# Altium schematic sheet signal-light-11.SchDoc
size A4; SheetNumber: 14; SheetTotal: 21
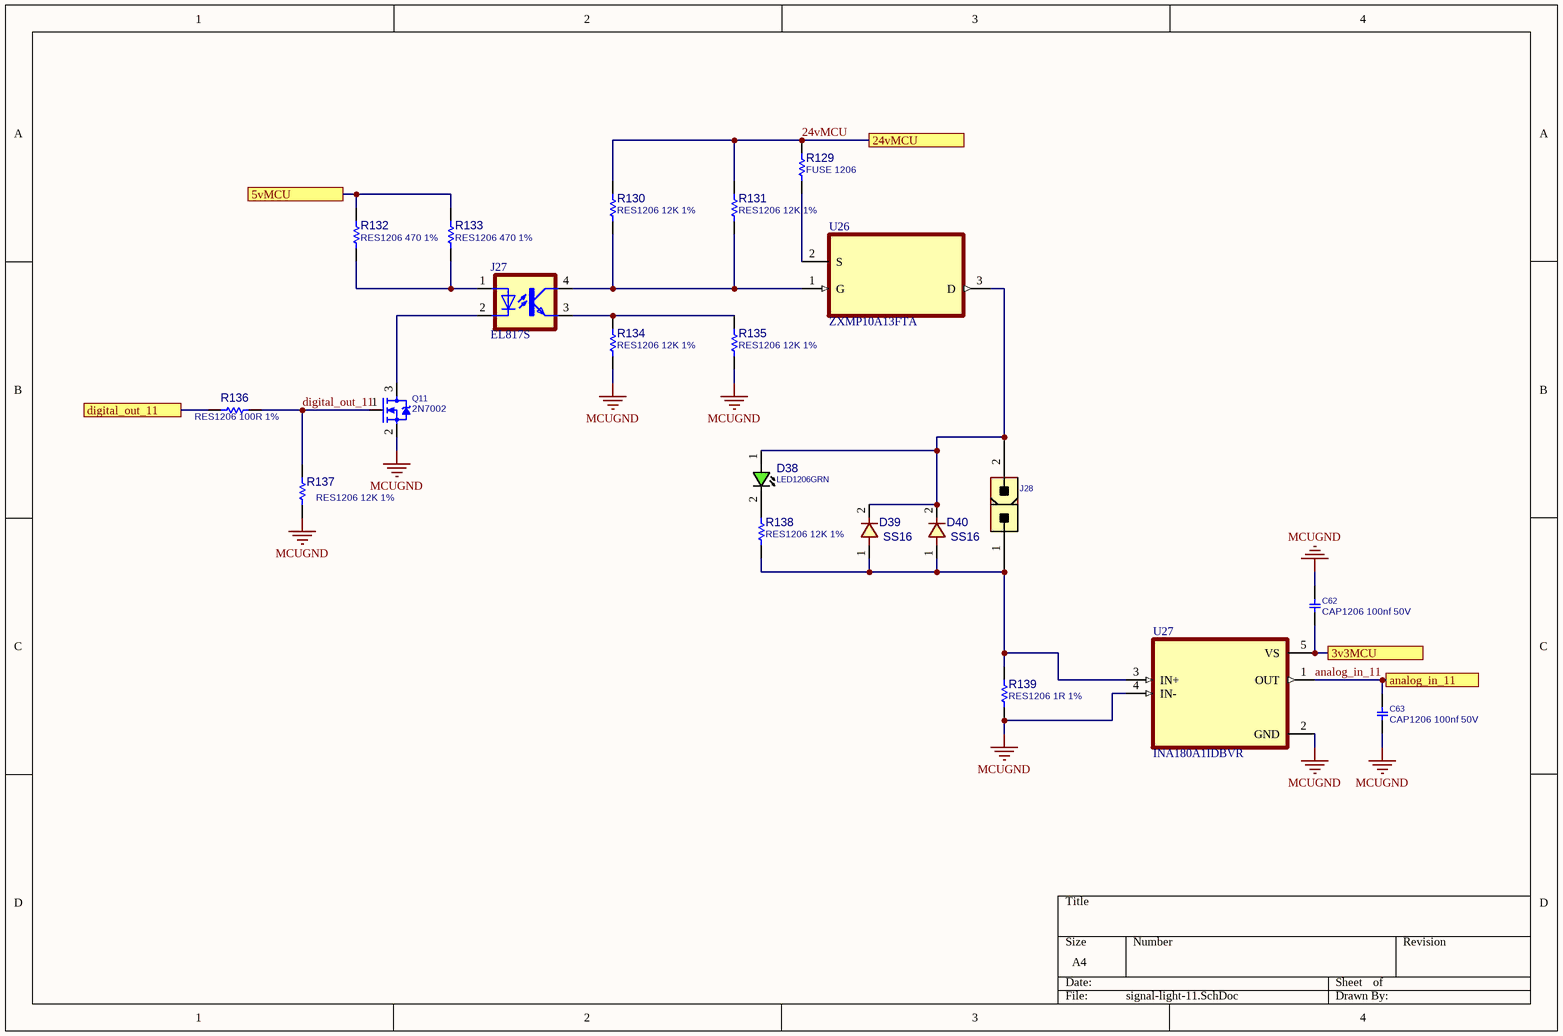
[diagram p0: signal-light-11.SchDoc]

## Parts
C62  CAP1206 100nf 50V  [C1206]
C63  CAP1206 100nf 50V  [C1206]
D38  LED1206GRN  [LED1206GRN]
D39  SS16  [D_SMA]
D40  SS16  [D_SMA]
J27  EL817S  [SOIC254P1030X460-4N]
J28  CONN_ATXPWR_2  [ATXPWR_2]  (value not drawn)
Q11  2N7002  [SOT23_3]
R129  FUSE 1206  [R1206]
R130  RES1206 12K 1%  [R1206]
R131  RES1206 12K 1%  [R1206]
R132  RES1206 470 1%  [R1206]
R133  RES1206 470 1%  [R1206]
R134  RES1206 12K 1%  [R1206]
R135  RES1206 12K 1%  [R1206]
R136  RES1206 100R 1%  [R1206]
R137  RES1206 12K 1%  [R1206]
R138  RES1206 12K 1%  [R1206]
R139  RES1206 1R 1%  [R1206]
U26  ZXMP10A13FTA  [SOT95P230X110-3N]
U27  INA180A1IDBVR  [SOT95P280X145-5N]

## Ports
3v3MCU, 5vMCU, 24vMCU, analog_in_11, digital_out_11

## Nets
MCUGND: C62.1 C63.2 Q11.2(SOURCE) R134.2 R135.2 R137.2 R139.2 U27.2(GND) U27.4(IN-)
3v3MCU: C62.2 U27.5(VS) ; port 3v3MCU
5vMCU: R132.2 R133.2 ; port 5vMCU
24vMCU: R129.1 R130.1 R131.1 ; port 24vMCU
analog_in_11: C63.1 U27.1(OUT) ; port analog_in_11
digital_out_11: Q11.1(GATE) R136.2 R137.1
digital_out_11: R136.1 ; port digital_out_11  [a separate net that carries the same name]
NetD38_1: D38.1(ANODE) D39.2 D40.2 J28.2 U26.3(D)
NetD38_2: D38.2(CATHODE) R138.1
NetD39_1: D39.1 D40.1 J28.1 R138.2 R139.1 U27.3(IN+)
NetJ27_1: J27.1(A) R132.1 R133.1
NetJ27_2: J27.2(C) Q11.3(DRAIN)
NetJ27_3: J27.3(EMIT) R134.1 R135.1
NetJ27_4: J27.4(COL) R130.2 R131.2 U26.1(G)
NetR129_2: R129.2 U26.2(S)

## Library data of the parts
C62 C63 = CAP_SMD_MLCC_1206: CAP, MLCC; PARAM: -, -%; MANF_P#: MANF_PART#; PARAM2: -V; PRICE: 100= 1$; MANF: -; ASSEMBLY: ASSEMBLY
D38 = LED_SMD_1206_GRN: LED, SMD, 1206, GREEN; PARAM: 20mA; DESC: DESCRIPTION; PARAM2: 2.2V; MANF: -; ASSEMBLY: ASSEMBLY; PRICE: 36t@Javan; MANF_P#: -; VALUE: LED1206GRN; MountType: SMT; PartType: LED
D39 D40 = DIODE_SMD_1N4001: DIODE, GENERAL PURPOSE, 50V/1A; DESC: DESCRIPTION; PARAM: 50V VRRM; PARAM2: 1A; MANF_P#: 1N4001; MANF: MANF; ASSEMBLY: ASSEMBLY; PRICE: PRICE; VALUE: SS16
J27 = EL817S: Optoisolator Transistor Output 5000Vrms 1 Channel 4-SMD; MF: Everlight Electronics; SnapEDA_Link: https://www.snapeda.com/parts/EL817S/Everlight+Electronics+Co+Ltd/view-part/?ref=snap; Package: SMD-4 Everlight Electronics Co Ltd; Value: *; MP: EL817S; Check_prices: https://www.snapeda.com/parts/EL817S/Everlight+Electronics+Co+Ltd/view-part/?ref=eda
J28 = CONN_ATXPWR_2: CONN, ATX POWER, 2 P; MANF: Molex; MANF_P#: 39281023; VALUE: CONN_ATXPWR_2; MountType: THD; PACKAGE: ATXPWR-2pin; Part Type: Conn.
Q11 = MOSN_2N7002_SOT23: MOSFET, N-CH, 60V, 0.3A; MANF: NXP; ASSEMBLY: ASSEMBLY; MANF_P#: 2N7002; PARAM2: 60v; PARAM: 0.3A; PRICE: 0.3t@Javan; VALUE: 2N7002
R129-R139 = RES_SMD_1206: RESISTOR, SMD; PARAM: 1%, 0.25W; DESC: DESCRIPTION; DIST#: MOUSER; MANF_P#: -; MANF: -; ASSEMBLY: ASSEMBLY; PRICE: -; PARAM2: -
U26 = ZXMP10A13FTA: P-Channel 100 V 600mA (Ta) 625mW (Ta) Surface Mount SOT-23-3; MF: Diodes Inc.; Purchase-URL: https://pricing.snapeda.com/search/part/ZXMP10A13FTA/?ref=eda; Package: SOT-23-3 Diodes Inc.; SnapEDA_Link: https://www.snapeda.com/parts/ZXMP10A13FTA/Diodes+Inc./view-part/?ref=snap; Availability: In Stock; Value: *; MP: ZXMP10A13FTA; Check_prices: https://www.snapeda.com/parts/ZXMP10A13FTA/Diodes+Inc./view-part/?ref=eda; Price: None
U27 = INA180A1IDBVR: 26V, 350kHz current sense amplifier; MF: Texas Instruments; SnapEDA_Link: https://www.snapeda.com/parts/INA180A1IDBVR/Texas+Instruments/view-part/?ref=snap; Package: SOT-23-5 Texas Instruments; Value: *; MP: INA180A1IDBVR; Check_prices: https://www.snapeda.com/parts/INA180A1IDBVR/Texas+Instruments/view-part/?ref=eda